# Altium schematic sheet 10_UNIVERSAL_INPUTS.SchDoc: Схема электрическая принципиальная
size 420 x 297 mm; ApprovedBy: Скрябин; CheckedBy: Скрябин; Author: Корсунов; CompanyName: РТУ МИРЭА; SheetNumber: 10; SheetTotal: 11; PageSetup: Record=PageOptions|CenterHorizontal=True|CenterVertical=True|PrintScale=0.94|XCorrection=1.00|YCorrection=1.00|PrintKind=1|BorderSize=5000000|LeftOffset=0|BottomOffset=0|Orientation=1|PaperLength=1000|PaperWidth=1000|Scale=100|PaperSource=7|PrintQuality=-4|MediaType=1|DitherType=10|PaperKind=A4|PrintScaleMode=1; DecimalNumber: RP23.000001.010 Э3; Name1: Модуль ввода-вывода; lit_A: О; Name2: RP2350 OPC UA
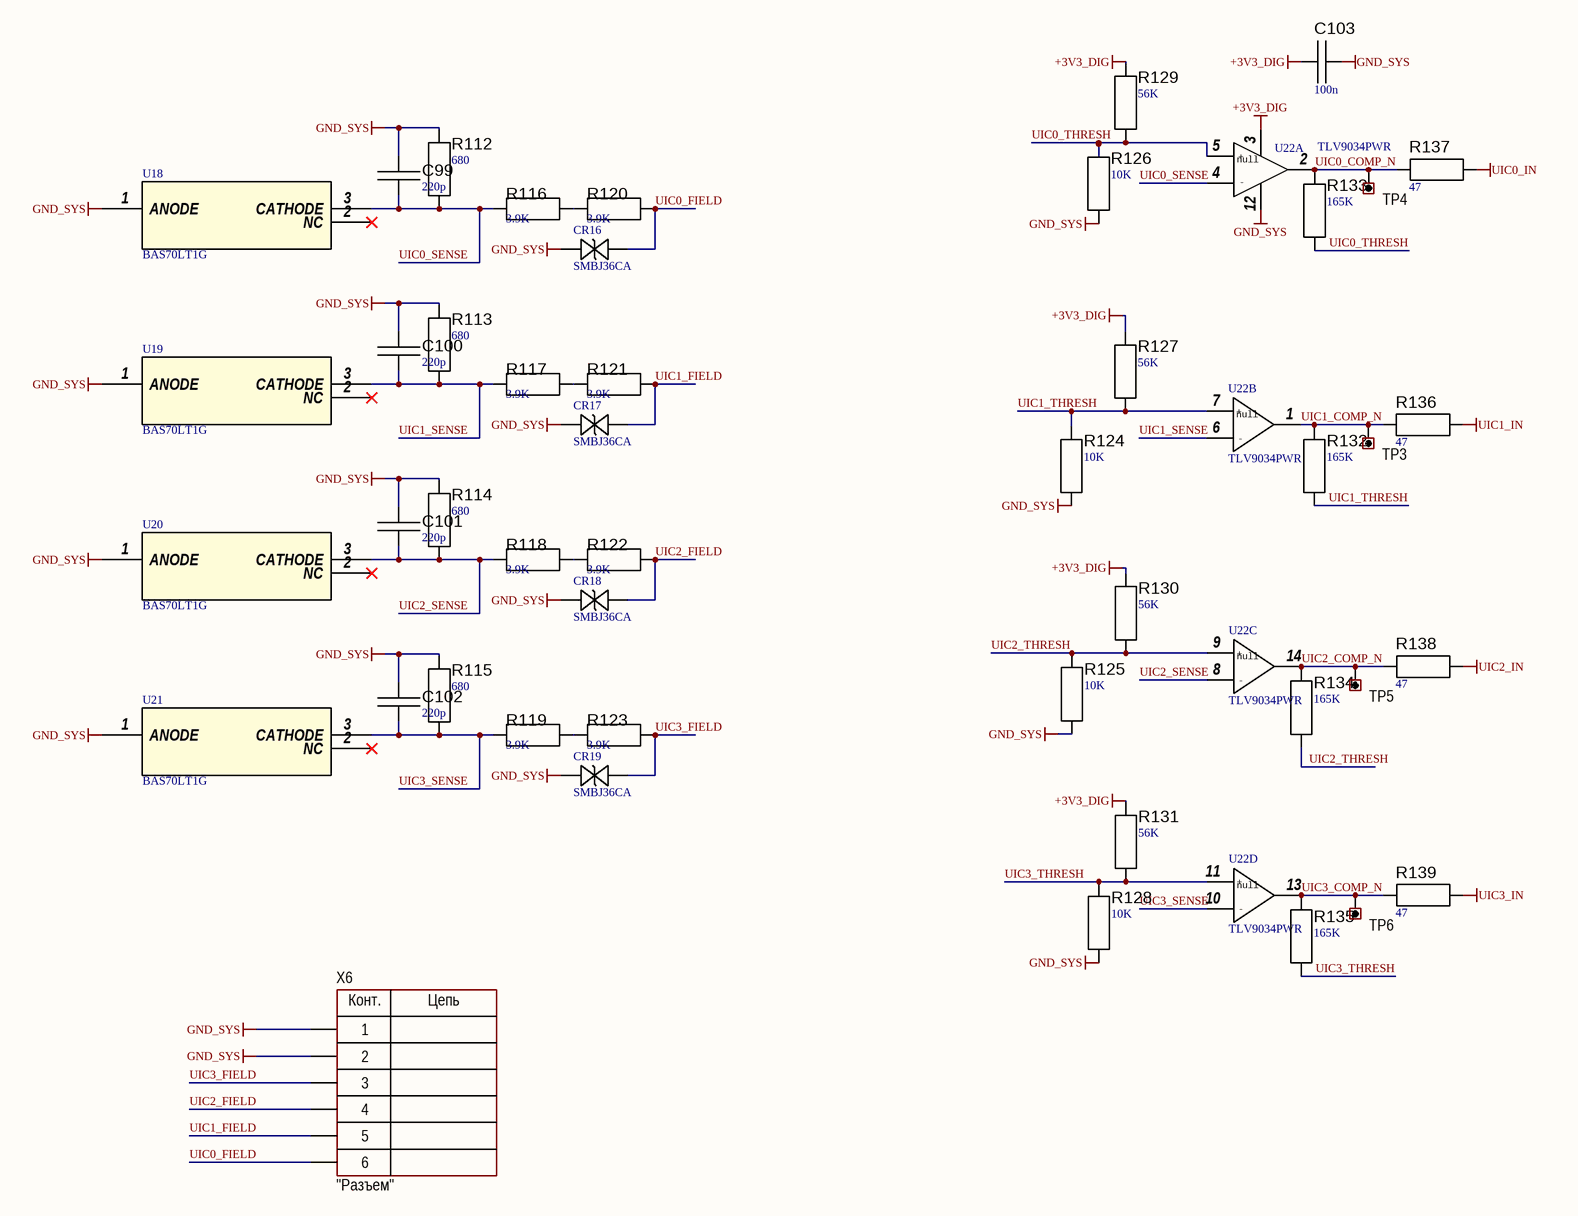
[diagram p0: 10_UNIVERSAL_INPUTS.SchDoc]

## Parts
C99  value 220p  [C_0603]  (hidden comment: Capacitor)
C100  value 220p  [C_0603]  (hidden comment: Capacitor)
C101  value 220p  [C_0603]  (hidden comment: Capacitor)
C102  value 220p  [C_0603]  (hidden comment: Capacitor)
C103  value 100n  [C_0603]  (hidden comment: Capacitor)
CR16  SMBJ36CA  [SMBJSeries_LTF]
CR17  SMBJ36CA  [SMBJSeries_LTF]
CR18  SMBJ36CA  [SMBJSeries_LTF]
CR19  SMBJ36CA  [SMBJSeries_LTF]
R112  value 680  [R_0603]  (hidden comment: Resistor)
R113  value 680  [R_0603]  (hidden comment: Resistor)
R114  value 680  [R_0603]  (hidden comment: Resistor)
R115  value 680  [R_0603]  (hidden comment: Resistor)
R116  value 3.9K  [R_0603]  (hidden comment: Resistor)
R117  value 3.9K  [R_0603]  (hidden comment: Resistor)
R118  value 3.9K  [R_0603]  (hidden comment: Resistor)
R119  value 3.9K  [R_0603]  (hidden comment: Resistor)
R120  value 3.9K  [R_0603]  (hidden comment: Resistor)
R121  value 3.9K  [R_0603]  (hidden comment: Resistor)
R122  value 3.9K  [R_0603]  (hidden comment: Resistor)
R123  value 3.9K  [R_0603]  (hidden comment: Resistor)
R124  value 10K  [R_0603]  (hidden comment: Resistor)
R125  value 10K  [R_0603]  (hidden comment: Resistor)
R126  value 10K  [R_0603]  (hidden comment: Resistor)
R127  value 56K  [R_0603]  (hidden comment: Resistor)
R128  value 10K  [R_0603]  (hidden comment: Resistor)
R129  value 56K  [R_0603]  (hidden comment: Resistor)
R130  value 56K  [R_0603]  (hidden comment: Resistor)
R131  value 56K  [R_0603]  (hidden comment: Resistor)
R132  value 165K  [R_0603]  (hidden comment: Resistor)
R133  value 165K  [R_0603]  (hidden comment: Resistor)
R134  value 165K  [R_0603]  (hidden comment: Resistor)
R135  value 165K  [R_0603]  (hidden comment: Resistor)
R136  value 47  [R_0603]  (hidden comment: Resistor)
R137  value 47  [R_0603]  (hidden comment: Resistor)
R138  value 47  [R_0603]  (hidden comment: Resistor)
R139  value 47  [R_0603]  (hidden comment: Resistor)
TP3  (no value)  [CON: 5000 (Keystone)]
TP4  (no value)  [CON: 5000 (Keystone)]
TP5  (no value)  [CON: 5000 (Keystone)]
TP6  (no value)  [CON: 5000 (Keystone)]
U18  BAS70LT1G  [SOT-23_ONS]
U19  BAS70LT1G  [SOT-23_ONS]
U20  BAS70LT1G  [SOT-23_ONS]
U21  BAS70LT1G  [SOT-23_ONS]
U22  TLV9034PWR  [PW0014A-IPC_A]  (parts A,B,C,D of 4)
X6  CommentText: "Разъем"  [CON: DG350-3.5-06P]

## Nets
+3V3_DIG: C103.2 R127.2 R129.2 R130.2 R131.2 U22.3(V+)
GND_SYS: C99.2 C100.2 C101.2 C102.2 C103.1 CR16.2 CR17.2 CR18.2 CR19.2 R112.2 R113.2 R114.2 R115.2 R124.1 R125.1 R126.1 R128.1 U18.1(ANODE) U19.1(ANODE) U20.1(ANODE) U21.1(ANODE) U22.12(V-) X6.1 X6.2
UIC0_IN: R137.1
UIC1_IN: R136.1
UIC2_IN: R138.1
UIC3_IN: R139.1
UIC0_COMP_N: R133.2 R137.2 TP4.1 U22.2(OUT1)
UIC0_FIELD: CR16.1 R120.2 X6.6
UIC0_SENSE: C99.1 R112.1 R116.1 U18.3(CATHODE) U22.4(IN1-)
UIC0_THRESH: R126.2 R129.1 R133.1 U22.5(IN1+)
UIC1_COMP_N: R132.2 R136.2 TP3.1 U22.1(OUT2)
UIC1_FIELD: CR17.1 R121.2 X6.5
UIC1_SENSE: C100.1 R113.1 R117.1 U19.3(CATHODE) U22.6(IN2-)
UIC1_THRESH: R124.2 R127.1 R132.1 U22.7(IN2+)
UIC2_COMP_N: R134.2 R138.2 TP5.1 U22.14(OUT3)
UIC2_FIELD: CR18.1 R122.2 X6.4
UIC2_SENSE: C101.1 R114.1 R118.1 U20.3(CATHODE) U22.8(IN3-)
UIC2_THRESH: R125.2 R130.1 R134.1 U22.9(IN3+)
UIC3_COMP_N: R135.2 R139.2 TP6.1 U22.13(OUT4)
UIC3_FIELD: CR19.1 R123.2 X6.3
UIC3_SENSE: C102.1 R115.1 R119.1 U21.3(CATHODE) U22.10(IN4-)
UIC3_THRESH: R128.2 R131.1 R135.1 U22.11(IN4+)
NetR116_2: R116.2 R120.1
NetR117_2: R117.2 R121.1
NetR118_2: R118.2 R122.1
NetR119_2: R119.2 R123.1

Not connected (* = marked no-connect by the designer): U18 2(NC)*; U19 2(NC)*; U20 2(NC)*; U21 2(NC)*

## Notes on the sheet
- Перв.примен.
- Справ.№
- Подп. и дата
- Инв.№ дубл.
- Взам.инв.№
- Подп.и дата
- Разраб.
- Изм.
- Лист
- № докум.
- Подп.
- Дата
- Лит.
- Масштаб
- Масса
- Т.контр.
- Пров.
- СХЕМА   ЭЛЕКТРИЧЕСКАЯ
- ПРИНЦИПИАЛЬНАЯ
- Листов
- Инв.№ подл.
- Утв.
- Н.контр.
- Нач.сект.
- Формат  A3
- (in symbol Connector_terminal_6pin) Конт.; Цепь
- (in symbol TLV9034PWR, part A) +; null; -
- (in symbol TLV9034PWR, part B) +; null; -
- (in symbol TLV9034PWR, part C) +; null; -
- (in symbol TLV9034PWR, part D) +; null; -

## Library data of the parts
C99-C103 = Capacitor: SimulationGenericComponent: True
CR16-CR19 = SMBJ36CA: No Description Available; Manufacturer_Name: Littelfuse Inc; Copyright: Copyright (C) 2026 Ultra Librarian. All rights reserved.; Manufacturer_Part_Number: SMBJ36CA
R112-R139 = Resistor: TC1: 0; SimulationGenericComponent: True; TC2: 0
TP3-TP6 = Connector_Test_Point: Manufacturer: Keystone; ValueManufacturerPartNumber: Test point, Keystone, 5001; PartNumber: 5001; TypeConnector: Test point; HelpURL: https://www.digikey.com/product-detail/en/keystone-electronics/5001/36-5001-ND/255327
U18-U21 = BAS70LT1G: No Description Available; Manufacturer_Name: onsemi; Copyright: Copyright (C) 2026 Ultra Librarian. All rights reserved.; Manufacturer_Part_Number: BAS70LT1G; RefDes: RefDes; Type: Type
U22 = TLV9034PWR: High-performance, quad low-voltage push-pull comparator 14-TSSOP -40 to 125; Manufacturer_Name: Texas Instruments; TYPE: TYPE; RefDes: RefDes; Copyright: Copyright (C) 2026 Ultra Librarian. All rights reserved.; Manufacturer_Part_Number: TLV9034PWR; Datasheet: https://www.ti.com/lit/gpn/tlv9034
X6 = Connector_terminal_6pin: Manufacturer: Degson; ValueManufacturerPartNumber: Terminal connector, 6pin, 3.5mm, 300VAC, 10A; PartNumber: DG350-3.5-06P-14; TypeConnector: Terminal connector; VoltageMax: 300VAC; Pitch: 3.5mm; CurrentMax: 10A; Multichannel: 6pin; HelpURL: https://www.compel.ru/infosheet/DEGSON/DG350-3.5-06P-14-00AH